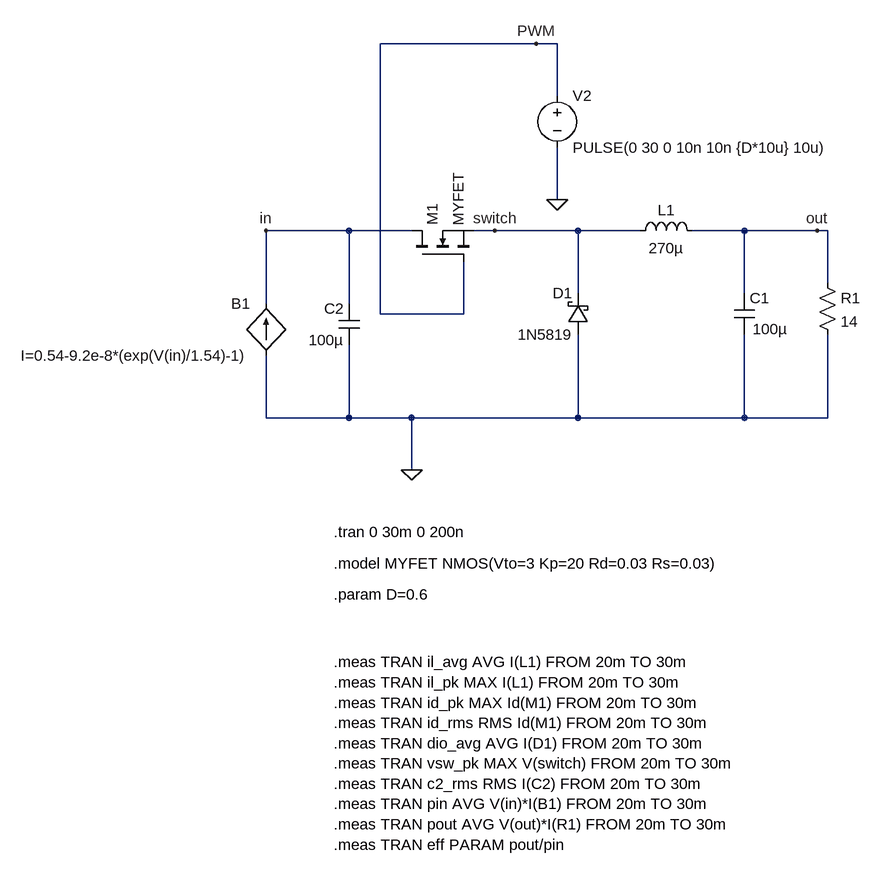
[diagram p0: schematic Draft1.asc]
Draft1.asc, the LTspice schematic file:
Version 4.1
SHEET 1 880 1028
WIRE 336 -256 96 -256
WIRE 368 -256 336 -256
WIRE 368 -176 368 -256
WIRE 368 -16 368 -96
WIRE 48 32 -80 32
WIRE 144 32 48 32
WIRE 272 32 240 32
WIRE 400 32 272 32
WIRE 496 32 400 32
WIRE 656 32 576 32
WIRE 768 32 656 32
WIRE 784 32 768 32
WIRE 784 112 784 32
WIRE 400 128 400 32
WIRE 656 128 656 32
WIRE -80 144 -80 32
WIRE 48 144 48 32
WIRE 96 160 96 -256
WIRE 224 160 224 80
WIRE 224 160 96 160
WIRE -80 320 -80 224
WIRE 48 320 48 208
WIRE 48 320 -80 320
WIRE 144 320 48 320
WIRE 400 320 400 192
WIRE 400 320 144 320
WIRE 656 320 656 192
WIRE 656 320 400 320
WIRE 784 320 784 192
WIRE 784 320 656 320
WIRE 144 400 144 320
FLAG 144 400 0
FLAG 368 -16 0
FLAG 336 -256 PWM
FLAG 768 32 out
FLAG 272 32 switch
FLAG -80 32 in
SYMBOL nmos 144 80 R270
SYMATTR InstName M1
SYMATTR Value MYFET
SYMBOL schottky 416 192 R180
WINDOW 0 24 64 Left 2
WINDOW 3 24 0 Left 2
SYMATTR InstName D1
SYMATTR Value 1N5819
SYMBOL ind 480 48 R270
WINDOW 0 32 56 VTop 2
WINDOW 3 5 56 VBottom 2
SYMATTR InstName L1
SYMATTR Value 270µ
SYMATTR SpiceLine Rser=1m
SYMBOL cap 640 128 R0
WINDOW 3 29 55 Left 2
SYMATTR InstName C1
SYMATTR Value 100µ
SYMBOL res 768 96 R0
SYMATTR InstName R1
SYMATTR Value 14
SYMBOL cap 64 208 R180
WINDOW 0 24 56 Left 2
WINDOW 3 24 8 Left 2
SYMATTR InstName C2
SYMATTR Value 100µ
SYMBOL voltage 368 -192 R0
WINDOW 123 0 0 Left 0
WINDOW 39 0 0 Left 0
SYMATTR InstName V2
SYMATTR Value PULSE(0 30 0 10n 10n {D*10u} 10u)
SYMBOL bi -80 224 R180
WINDOW 0 24 80 Left 2
WINDOW 3 24 0 Left 2
SYMATTR InstName B1
SYMATTR Value I=0.54-9.2e-8*(exp(V(in)/1.54)-1)
TEXT 24 496 Left 2 !.tran 0 30m 0 200n
TEXT 24 544 Left 2 !.model MYFET NMOS(Vto=3 Kp=20 Rd=0.03 Rs=0.03)
TEXT 24 592 Left 2 !.param D=0.6
TEXT 24 696 Left 2 !.meas TRAN il_avg AVG I(L1) FROM 20m TO 30m\n.meas TRAN il_pk MAX I(L1) FROM 20m TO 30m\n.meas TRAN id_pk MAX Id(M1) FROM 20m TO 30m\n.meas TRAN id_rms RMS Id(M1) FROM 20m TO 30m\n.meas TRAN dio_avg AVG I(D1) FROM 20m TO 30m\n.meas TRAN vsw_pk MAX V(switch) FROM 20m TO 30m\n.meas TRAN c2_rms RMS I(C2) FROM 20m TO 30m\n.meas TRAN pin AVG V(in)*I(B1) FROM 20m TO 30m\n.meas TRAN pout AVG V(out)*I(R1) FROM 20m TO 30m\n.meas TRAN eff PARAM pout/pin

The netlist it stands for:
* Draft1.asc
M1 in PWM switch switch MYFET
D1 0 switch 1N5819
L1 switch out 270µ Rser=1m
C1 out 0 100µ
R1 out 0 14
C2 0 in 100µ
V2 PWM 0 PULSE(0 30 0 10n 10n {D*10u} 10u)
B1 0 in I=0.54-9.2e-8*(exp(V(in)/1.54)-1)
.model D D
.lib standard.dio
.model NMOS NMOS
.model PMOS PMOS
.lib standard.mos
.tran 0 30m 0 200n
.model MYFET NMOS(Vto=3 Kp=20 Rd=0.03 Rs=0.03)
.param D=0.6
.meas TRAN il_avg AVG I(L1) FROM 20m TO 30m
.meas TRAN il_pk MAX I(L1) FROM 20m TO 30m
.meas TRAN id_pk MAX Id(M1) FROM 20m TO 30m
.meas TRAN id_rms RMS Id(M1) FROM 20m TO 30m
.meas TRAN dio_avg AVG I(D1) FROM 20m TO 30m
.meas TRAN vsw_pk MAX V(switch) FROM 20m TO 30m
.meas TRAN c2_rms RMS I(C2) FROM 20m TO 30m
.meas TRAN pin AVG V(in)*I(B1) FROM 20m TO 30m
.meas TRAN pout AVG V(out)*I(R1) FROM 20m TO 30m
.meas TRAN eff PARAM pout/pin
.backanno
.end